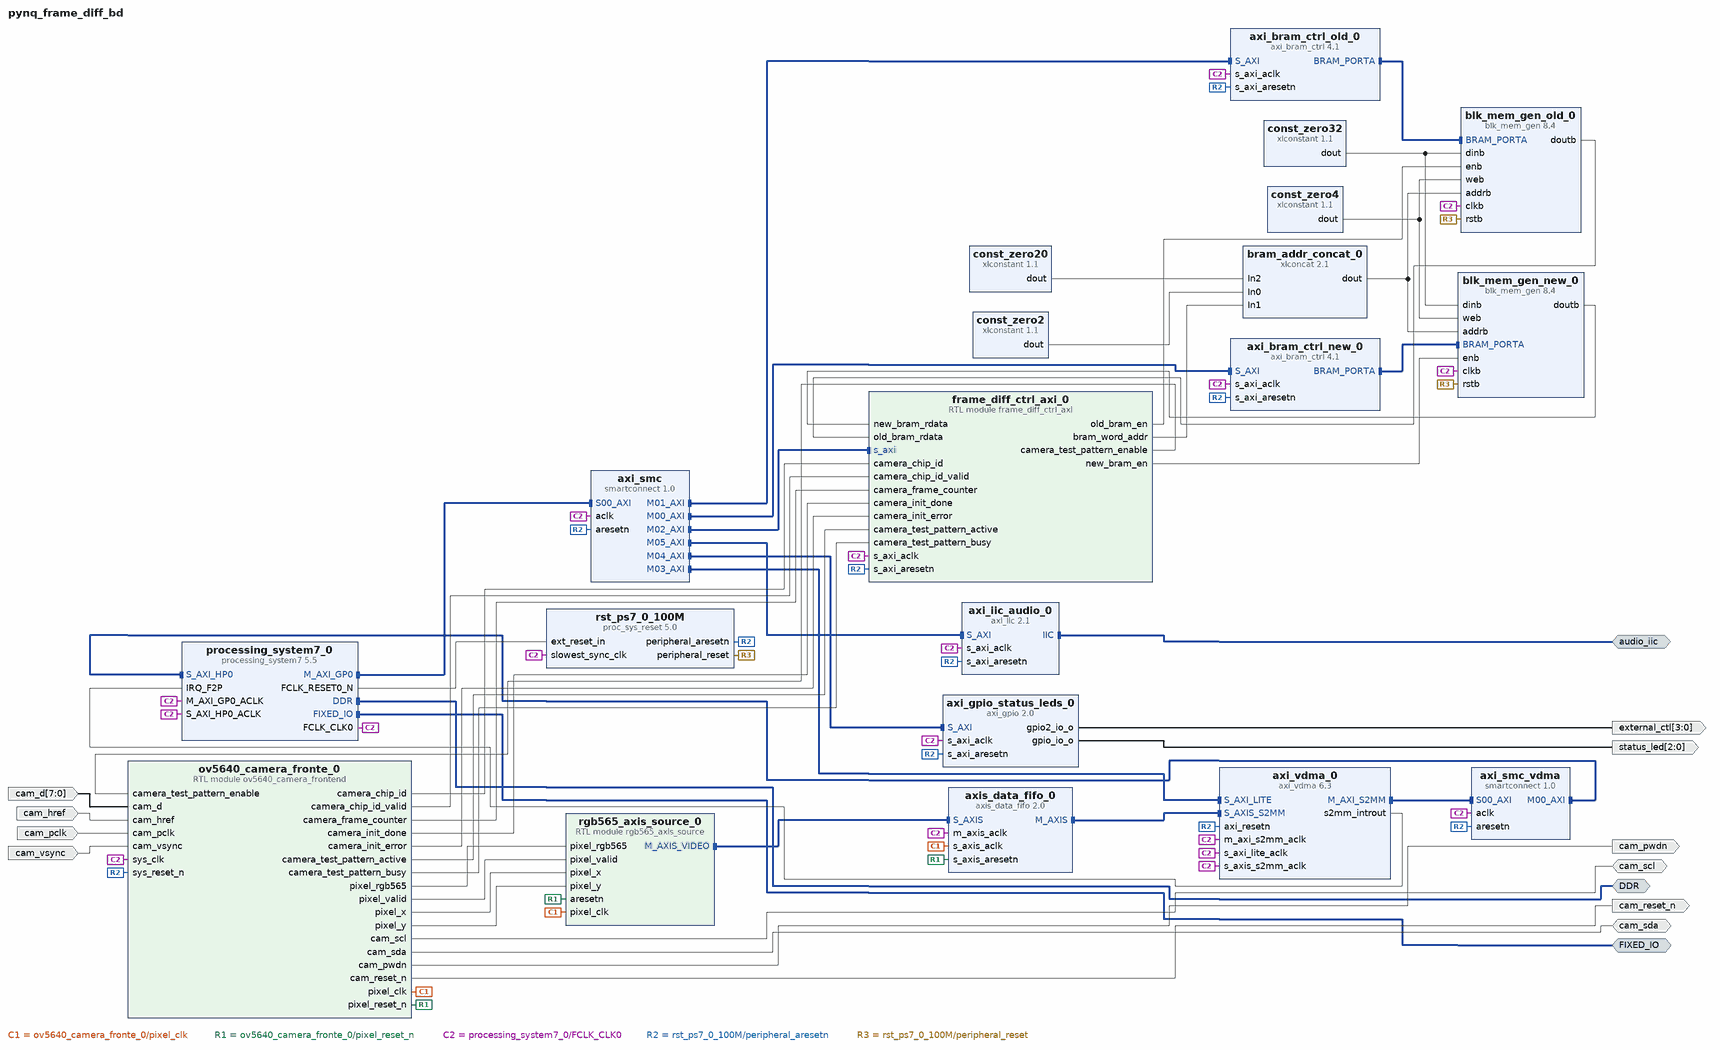
[diagram p0: block diagram of the top level]
# Vivado block design pynq_frame_diff_bd, xc7z020clg400-1, Vivado 2024.1
create_bd_design pynq_frame_diff_bd

create_bd_intf_port -mode Master -vlnv xilinx.com:interface:ddrx_rtl:1.0 DDR
create_bd_intf_port -mode Master -vlnv xilinx.com:display_processing_system7:fixedio_rtl:1.0 FIXED_IO
create_bd_intf_port -mode Master -vlnv xilinx.com:interface:iic_rtl:1.0 audio_iic
create_bd_port -dir I cam_pclk
create_bd_port -dir I -from 7 -to 0 cam_d
create_bd_port -dir I cam_vsync
create_bd_port -dir I cam_href
create_bd_port -dir IO cam_scl
create_bd_port -dir IO cam_sda
create_bd_port -dir O cam_reset_n
create_bd_port -dir O cam_pwdn
create_bd_port -dir O -from 2 -to 0 status_led
create_bd_port -dir O -from 3 -to 0 external_ctl

create_bd_cell -type ip -vlnv xilinx.com:ip:processing_system7:5.5 processing_system7_0
set_property -dict [list \
  CONFIG.PCW_APU_PERIPHERAL_FREQMHZ 650 \
  CONFIG.PCW_CRYSTAL_PERIPHERAL_FREQMHZ 50 \
  CONFIG.PCW_ENET0_ENET0_IO {MIO 16 .. 27} \
  CONFIG.PCW_ENET0_GRP_MDIO_ENABLE 1 \
  CONFIG.PCW_ENET0_GRP_MDIO_IO {MIO 52 .. 53} \
  CONFIG.PCW_ENET0_PERIPHERAL_ENABLE 1 \
  CONFIG.PCW_ENET0_RESET_ENABLE 1 \
  CONFIG.PCW_ENET0_RESET_IO {MIO 9} \
  CONFIG.PCW_ENET_RESET_ENABLE 1 \
  CONFIG.PCW_ENET_RESET_SELECT {Share reset pin} \
  CONFIG.PCW_FPGA0_PERIPHERAL_FREQMHZ 100 \
  CONFIG.PCW_FPGA1_PERIPHERAL_FREQMHZ 50 \
  CONFIG.PCW_GPIO_MIO_GPIO_ENABLE 1 \
  CONFIG.PCW_GPIO_MIO_GPIO_IO MIO \
  CONFIG.PCW_I2C_RESET_ENABLE 1 \
  CONFIG.PCW_IRQ_F2P_INTR 1 \
  CONFIG.PCW_M_AXI_GP0_FREQMHZ 10 \
  CONFIG.PCW_PERIPHERAL_BOARD_PRESET part0 \
  CONFIG.PCW_PRESET_BANK1_VOLTAGE {LVCMOS 1.8V} \
  CONFIG.PCW_QSPI_GRP_FBCLK_ENABLE 1 \
  CONFIG.PCW_QSPI_GRP_FBCLK_IO {MIO 8} \
  CONFIG.PCW_QSPI_GRP_SINGLE_SS_ENABLE 1 \
  CONFIG.PCW_QSPI_GRP_SINGLE_SS_IO {MIO 1 .. 6} \
  CONFIG.PCW_QSPI_PERIPHERAL_ENABLE 1 \
  CONFIG.PCW_QSPI_QSPI_IO {MIO 1 .. 6} \
  CONFIG.PCW_SD0_GRP_CD_ENABLE 1 \
  CONFIG.PCW_SD0_GRP_CD_IO {MIO 47} \
  CONFIG.PCW_SD0_GRP_WP_ENABLE 0 \
  CONFIG.PCW_SD0_PERIPHERAL_ENABLE 1 \
  CONFIG.PCW_SD0_SD0_IO {MIO 40 .. 45} \
  CONFIG.PCW_SDIO_PERIPHERAL_FREQMHZ 50 \
  CONFIG.PCW_SINGLE_QSPI_DATA_MODE x4 \
  CONFIG.PCW_S_AXI_HP0_FREQMHZ 10 \
  CONFIG.PCW_UART0_PERIPHERAL_ENABLE 1 \
  CONFIG.PCW_UART0_UART0_IO {MIO 14 .. 15} \
  CONFIG.PCW_UART1_PERIPHERAL_ENABLE 0 \
  CONFIG.PCW_UART_PERIPHERAL_FREQMHZ 100 \
  CONFIG.PCW_UIPARAM_DDR_BUS_WIDTH {16 Bit} \
  CONFIG.PCW_UIPARAM_DDR_FREQ_MHZ 525 \
  CONFIG.PCW_UIPARAM_DDR_PARTNO {MT41J256M16 RE-125} \
  CONFIG.PCW_USB0_PERIPHERAL_ENABLE 1 \
  CONFIG.PCW_USB0_RESET_ENABLE 1 \
  CONFIG.PCW_USB0_RESET_IO {MIO 46} \
  CONFIG.PCW_USB0_USB0_IO {MIO 28 .. 39} \
  CONFIG.PCW_USB_RESET_ENABLE 1 \
  CONFIG.PCW_USB_RESET_SELECT {Share reset pin} \
  CONFIG.PCW_USE_FABRIC_INTERRUPT 1 \
  CONFIG.PCW_USE_S_AXI_HP0 1 \
] [get_bd_cells processing_system7_0]
# 495 more settings of processing_system7_0 are not shown: defaults, MIO pin electricals, DDR timing, and values the tool derives
create_bd_cell -type ip -vlnv xilinx.com:ip:axi_bram_ctrl:4.1 axi_bram_ctrl_old_0
set_property -dict {CONFIG.SINGLE_PORT_BRAM 1} [get_bd_cells axi_bram_ctrl_old_0]
create_bd_cell -type ip -vlnv xilinx.com:ip:axi_bram_ctrl:4.1 axi_bram_ctrl_new_0
set_property -dict {CONFIG.SINGLE_PORT_BRAM 1} [get_bd_cells axi_bram_ctrl_new_0]
create_bd_cell -type ip -vlnv xilinx.com:ip:blk_mem_gen:8.4 blk_mem_gen_old_0
set_property -dict [list \
  CONFIG.Assume_Synchronous_Clk true \
  CONFIG.EN_SAFETY_CKT false \
  CONFIG.Memory_Type True_Dual_Port_RAM \
] [get_bd_cells blk_mem_gen_old_0]
create_bd_cell -type ip -vlnv xilinx.com:ip:blk_mem_gen:8.4 blk_mem_gen_new_0
set_property -dict [list \
  CONFIG.Assume_Synchronous_Clk true \
  CONFIG.EN_SAFETY_CKT false \
  CONFIG.Memory_Type True_Dual_Port_RAM \
] [get_bd_cells blk_mem_gen_new_0]
create_bd_cell -type ip -vlnv xilinx.com:ip:smartconnect:1.0 axi_smc
set_property -dict {CONFIG.NUM_MI 6 CONFIG.NUM_SI 1} [get_bd_cells axi_smc]
create_bd_cell -type ip -vlnv xilinx.com:ip:proc_sys_reset:5.0 rst_ps7_0_100M
create_bd_cell -type ip -vlnv xilinx.com:ip:xlconstant:1.1 const_zero32
set_property -dict {CONFIG.CONST_VAL 0 CONFIG.CONST_WIDTH 32} [get_bd_cells const_zero32]
create_bd_cell -type ip -vlnv xilinx.com:ip:xlconstant:1.1 const_zero4
set_property -dict {CONFIG.CONST_VAL 0 CONFIG.CONST_WIDTH 4} [get_bd_cells const_zero4]
create_bd_cell -type ip -vlnv xilinx.com:ip:xlconcat:2.1 bram_addr_concat_0
set_property -dict [list \
  CONFIG.IN0_WIDTH 2 \
  CONFIG.IN1_WIDTH 10 \
  CONFIG.IN2_WIDTH 20 \
  CONFIG.NUM_PORTS 3 \
] [get_bd_cells bram_addr_concat_0]
create_bd_cell -type ip -vlnv xilinx.com:ip:xlconstant:1.1 const_zero2
set_property -dict {CONFIG.CONST_VAL 0 CONFIG.CONST_WIDTH 2} [get_bd_cells const_zero2]
create_bd_cell -type ip -vlnv xilinx.com:ip:xlconstant:1.1 const_zero20
set_property -dict {CONFIG.CONST_VAL 0 CONFIG.CONST_WIDTH 20} [get_bd_cells const_zero20]
create_bd_cell -type module -reference rgb565_axis_source rgb565_axis_source_0
create_bd_cell -type ip -vlnv xilinx.com:ip:axis_data_fifo:2.0 axis_data_fifo_0
set_property -dict [list \
  CONFIG.FIFO_DEPTH 1024 \
  CONFIG.HAS_TKEEP 1 \
  CONFIG.HAS_TLAST 1 \
  CONFIG.IS_ACLK_ASYNC 1 \
  CONFIG.TDATA_NUM_BYTES 2 \
  CONFIG.TUSER_WIDTH 1 \
] [get_bd_cells axis_data_fifo_0]
create_bd_cell -type ip -vlnv xilinx.com:ip:axi_vdma:6.3 axi_vdma_0
set_property -dict [list \
  CONFIG.c_include_mm2s 0 \
  CONFIG.c_m_axi_s2mm_data_width 64 \
  CONFIG.c_num_fstores 2 \
  CONFIG.c_s2mm_genlock_mode 0 \
  CONFIG.c_s2mm_max_burst_length 16 \
] [get_bd_cells axi_vdma_0]
create_bd_cell -type ip -vlnv xilinx.com:ip:smartconnect:1.0 axi_smc_vdma
set_property -dict {CONFIG.NUM_MI 1 CONFIG.NUM_SI 1} [get_bd_cells axi_smc_vdma]
create_bd_cell -type module -reference ov5640_camera_frontend ov5640_camera_fronte_0
create_bd_cell -type module -reference frame_diff_ctrl_axi frame_diff_ctrl_axi_0
create_bd_cell -type ip -vlnv xilinx.com:ip:axi_gpio:2.0 axi_gpio_status_leds_0
set_property -dict [list \
  CONFIG.C_ALL_OUTPUTS 1 \
  CONFIG.C_ALL_OUTPUTS_2 1 \
  CONFIG.C_DOUT_DEFAULT 0x00000000 \
  CONFIG.C_DOUT_DEFAULT_2 0x00000000 \
  CONFIG.C_GPIO2_WIDTH 4 \
  CONFIG.C_GPIO_WIDTH 3 \
  CONFIG.C_INTERRUPT_PRESENT 0 \
  CONFIG.C_IS_DUAL 1 \
] [get_bd_cells axi_gpio_status_leds_0]
create_bd_cell -type ip -vlnv xilinx.com:ip:axi_iic:2.1 axi_iic_audio_0

# ---- connections ----

connect_bd_intf_net -intf_net audio_iic_net [get_bd_intf_pins axi_iic_audio_0/IIC] [get_bd_intf_ports audio_iic]
connect_bd_intf_net [get_bd_intf_pins axi_bram_ctrl_new_0/BRAM_PORTA] [get_bd_intf_pins blk_mem_gen_new_0/BRAM_PORTA]
connect_bd_intf_net [get_bd_intf_pins axi_bram_ctrl_old_0/BRAM_PORTA] [get_bd_intf_pins blk_mem_gen_old_0/BRAM_PORTA]
connect_bd_intf_net [get_bd_intf_pins axi_smc/M00_AXI] [get_bd_intf_pins axi_bram_ctrl_new_0/S_AXI]
connect_bd_intf_net [get_bd_intf_pins axi_smc/M01_AXI] [get_bd_intf_pins axi_bram_ctrl_old_0/S_AXI]
connect_bd_intf_net [get_bd_intf_pins axi_smc/M02_AXI] [get_bd_intf_pins frame_diff_ctrl_axi_0/s_axi]
connect_bd_intf_net [get_bd_intf_pins axi_smc/M03_AXI] [get_bd_intf_pins axi_vdma_0/S_AXI_LITE]
connect_bd_intf_net [get_bd_intf_pins axi_smc/M04_AXI] [get_bd_intf_pins axi_gpio_status_leds_0/S_AXI]
connect_bd_intf_net [get_bd_intf_pins axi_smc/M05_AXI] [get_bd_intf_pins axi_iic_audio_0/S_AXI]
connect_bd_intf_net [get_bd_intf_pins axi_smc_vdma/M00_AXI] [get_bd_intf_pins processing_system7_0/S_AXI_HP0]
connect_bd_intf_net [get_bd_intf_pins axi_vdma_0/M_AXI_S2MM] [get_bd_intf_pins axi_smc_vdma/S00_AXI]
connect_bd_intf_net [get_bd_intf_pins axis_data_fifo_0/M_AXIS] [get_bd_intf_pins axi_vdma_0/S_AXIS_S2MM]
connect_bd_intf_net [get_bd_intf_ports DDR] [get_bd_intf_pins processing_system7_0/DDR]
connect_bd_intf_net [get_bd_intf_ports FIXED_IO] [get_bd_intf_pins processing_system7_0/FIXED_IO]
connect_bd_intf_net [get_bd_intf_pins processing_system7_0/M_AXI_GP0] [get_bd_intf_pins axi_smc/S00_AXI]
connect_bd_intf_net [get_bd_intf_pins rgb565_axis_source_0/M_AXIS_VIDEO] [get_bd_intf_pins axis_data_fifo_0/S_AXIS]
connect_bd_net [get_bd_ports cam_scl] [get_bd_pins ov5640_camera_fronte_0/cam_scl]
connect_bd_net [get_bd_ports cam_sda] [get_bd_pins ov5640_camera_fronte_0/cam_sda]
connect_bd_net [get_bd_pins axi_gpio_status_leds_0/gpio_io_o] [get_bd_ports status_led]
connect_bd_net [get_bd_pins axi_vdma_0/s2mm_introut] [get_bd_pins processing_system7_0/IRQ_F2P]
connect_bd_net [get_bd_pins blk_mem_gen_new_0/doutb] [get_bd_pins frame_diff_ctrl_axi_0/new_bram_rdata]
connect_bd_net [get_bd_pins blk_mem_gen_old_0/doutb] [get_bd_pins frame_diff_ctrl_axi_0/old_bram_rdata]
connect_bd_net [get_bd_pins bram_addr_concat_0/dout] [get_bd_pins blk_mem_gen_old_0/addrb] [get_bd_pins blk_mem_gen_new_0/addrb]
connect_bd_net -net cam_d_0_1 [get_bd_ports cam_d] [get_bd_pins ov5640_camera_fronte_0/cam_d]
connect_bd_net -net cam_href_0_1 [get_bd_ports cam_href] [get_bd_pins ov5640_camera_fronte_0/cam_href]
connect_bd_net -net cam_pclk_0_1 [get_bd_ports cam_pclk] [get_bd_pins ov5640_camera_fronte_0/cam_pclk]
connect_bd_net -net cam_vsync_0_1 [get_bd_ports cam_vsync] [get_bd_pins ov5640_camera_fronte_0/cam_vsync]
connect_bd_net [get_bd_pins const_zero20/dout] [get_bd_pins bram_addr_concat_0/In2]
connect_bd_net [get_bd_pins const_zero2/dout] [get_bd_pins bram_addr_concat_0/In0]
connect_bd_net [get_bd_pins const_zero32/dout] [get_bd_pins blk_mem_gen_old_0/dinb] [get_bd_pins blk_mem_gen_new_0/dinb]
connect_bd_net [get_bd_pins const_zero4/dout] [get_bd_pins blk_mem_gen_old_0/web] [get_bd_pins blk_mem_gen_new_0/web]
connect_bd_net -net external_ctl_net [get_bd_pins axi_gpio_status_leds_0/gpio2_io_o] [get_bd_ports external_ctl]
connect_bd_net [get_bd_pins frame_diff_ctrl_axi_0/bram_word_addr] [get_bd_pins bram_addr_concat_0/In1]
connect_bd_net [get_bd_pins frame_diff_ctrl_axi_0/camera_test_pattern_enable] [get_bd_pins ov5640_camera_fronte_0/camera_test_pattern_enable]
connect_bd_net [get_bd_pins frame_diff_ctrl_axi_0/new_bram_en] [get_bd_pins blk_mem_gen_new_0/enb]
connect_bd_net [get_bd_pins frame_diff_ctrl_axi_0/old_bram_en] [get_bd_pins blk_mem_gen_old_0/enb]
connect_bd_net [get_bd_pins ov5640_camera_fronte_0/cam_pwdn] [get_bd_ports cam_pwdn]
connect_bd_net [get_bd_pins ov5640_camera_fronte_0/cam_reset_n] [get_bd_ports cam_reset_n]
connect_bd_net [get_bd_pins ov5640_camera_fronte_0/camera_chip_id] [get_bd_pins frame_diff_ctrl_axi_0/camera_chip_id]
connect_bd_net [get_bd_pins ov5640_camera_fronte_0/camera_chip_id_valid] [get_bd_pins frame_diff_ctrl_axi_0/camera_chip_id_valid]
connect_bd_net [get_bd_pins ov5640_camera_fronte_0/camera_frame_counter] [get_bd_pins frame_diff_ctrl_axi_0/camera_frame_counter]
connect_bd_net [get_bd_pins ov5640_camera_fronte_0/camera_init_done] [get_bd_pins frame_diff_ctrl_axi_0/camera_init_done]
connect_bd_net [get_bd_pins ov5640_camera_fronte_0/camera_init_error] [get_bd_pins frame_diff_ctrl_axi_0/camera_init_error]
connect_bd_net [get_bd_pins ov5640_camera_fronte_0/camera_test_pattern_active] [get_bd_pins frame_diff_ctrl_axi_0/camera_test_pattern_active]
connect_bd_net [get_bd_pins ov5640_camera_fronte_0/camera_test_pattern_busy] [get_bd_pins frame_diff_ctrl_axi_0/camera_test_pattern_busy]
connect_bd_net [get_bd_pins ov5640_camera_fronte_0/pixel_clk] [get_bd_pins rgb565_axis_source_0/pixel_clk] [get_bd_pins axis_data_fifo_0/s_axis_aclk]
connect_bd_net [get_bd_pins ov5640_camera_fronte_0/pixel_reset_n] \
  [get_bd_pins rgb565_axis_source_0/aresetn] [get_bd_pins axis_data_fifo_0/s_axis_aresetn]
connect_bd_net [get_bd_pins ov5640_camera_fronte_0/pixel_rgb565] [get_bd_pins rgb565_axis_source_0/pixel_rgb565]
connect_bd_net [get_bd_pins ov5640_camera_fronte_0/pixel_valid] [get_bd_pins rgb565_axis_source_0/pixel_valid]
connect_bd_net [get_bd_pins ov5640_camera_fronte_0/pixel_x] [get_bd_pins rgb565_axis_source_0/pixel_x]
connect_bd_net [get_bd_pins ov5640_camera_fronte_0/pixel_y] [get_bd_pins rgb565_axis_source_0/pixel_y]
connect_bd_net [get_bd_pins processing_system7_0/FCLK_CLK0] \
  [get_bd_pins processing_system7_0/M_AXI_GP0_ACLK] [get_bd_pins axi_smc/aclk] [get_bd_pins axi_bram_ctrl_new_0/s_axi_aclk] \
  [get_bd_pins rst_ps7_0_100M/slowest_sync_clk] [get_bd_pins axi_bram_ctrl_old_0/s_axi_aclk] \
  [get_bd_pins blk_mem_gen_old_0/clkb] [get_bd_pins blk_mem_gen_new_0/clkb] [get_bd_pins axis_data_fifo_0/m_axis_aclk] \
  [get_bd_pins axi_vdma_0/s_axi_lite_aclk] [get_bd_pins axi_vdma_0/m_axi_s2mm_aclk] [get_bd_pins axi_vdma_0/s_axis_s2mm_aclk] \
  [get_bd_pins processing_system7_0/S_AXI_HP0_ACLK] [get_bd_pins axi_smc_vdma/aclk] \
  [get_bd_pins axi_gpio_status_leds_0/s_axi_aclk] [get_bd_pins frame_diff_ctrl_axi_0/s_axi_aclk] \
  [get_bd_pins ov5640_camera_fronte_0/sys_clk] [get_bd_pins axi_iic_audio_0/s_axi_aclk]
connect_bd_net [get_bd_pins processing_system7_0/FCLK_RESET0_N] [get_bd_pins rst_ps7_0_100M/ext_reset_in]
connect_bd_net [get_bd_pins rst_ps7_0_100M/peripheral_aresetn] \
  [get_bd_pins axi_bram_ctrl_new_0/s_axi_aresetn] [get_bd_pins axi_smc/aresetn] \
  [get_bd_pins axi_bram_ctrl_old_0/s_axi_aresetn] [get_bd_pins axi_vdma_0/axi_resetn] [get_bd_pins axi_smc_vdma/aresetn] \
  [get_bd_pins axi_gpio_status_leds_0/s_axi_aresetn] [get_bd_pins frame_diff_ctrl_axi_0/s_axi_aresetn] \
  [get_bd_pins ov5640_camera_fronte_0/sys_reset_n] [get_bd_pins axi_iic_audio_0/s_axi_aresetn]
connect_bd_net [get_bd_pins rst_ps7_0_100M/peripheral_reset] [get_bd_pins blk_mem_gen_old_0/rstb] [get_bd_pins blk_mem_gen_new_0/rstb]
set_property HDL_ATTRIBUTE.BMM_INFO_PROCESSOR {arm > pynq_frame_diff_bd axi_bram_ctrl_new_0 pynq_frame_diff_bd axi_bram_ctrl_old_0} [get_bd_cells processing_system7_0]
set_property HDL_ATTRIBUTE.KEEP_HIERARCHY yes [get_bd_cells processing_system7_0]
set_property HDL_ATTRIBUTE.BMM_INFO_ADDRESS_SPACE {byte  0x42000000 32 > pynq_frame_diff_bd blk_mem_gen_old_0} [get_bd_cells axi_bram_ctrl_old_0]
set_property HDL_ATTRIBUTE.KEEP_HIERARCHY yes [get_bd_cells axi_bram_ctrl_old_0]
set_property HDL_ATTRIBUTE.BMM_INFO_ADDRESS_SPACE {byte  0x40000000 32 > pynq_frame_diff_bd blk_mem_gen_new_0} [get_bd_cells axi_bram_ctrl_new_0]
set_property HDL_ATTRIBUTE.KEEP_HIERARCHY yes [get_bd_cells axi_bram_ctrl_new_0]

# ---- address map ----
assign_bd_address -offset 0x00000000 -range 512M -target_address_space [get_bd_addr_spaces axi_vdma_0/Data_S2MM] [get_bd_addr_segs processing_system7_0/S_AXI_HP0/HP0_DDR_LOWOCM]
assign_bd_address -offset 0x40000000 -range 4K -target_address_space [get_bd_addr_spaces processing_system7_0/Data] [get_bd_addr_segs axi_bram_ctrl_new_0/S_AXI/Mem0]
assign_bd_address -offset 0x40002000 -range 4K -target_address_space [get_bd_addr_spaces processing_system7_0/Data] [get_bd_addr_segs frame_diff_ctrl_axi_0/s_axi/reg0]
assign_bd_address -offset 0x41200000 -range 4K -target_address_space [get_bd_addr_spaces processing_system7_0/Data] [get_bd_addr_segs axi_gpio_status_leds_0/S_AXI/Reg]
assign_bd_address -offset 0x41600000 -range 64K -target_address_space [get_bd_addr_spaces processing_system7_0/Data] [get_bd_addr_segs axi_iic_audio_0/S_AXI/Reg]
assign_bd_address -offset 0x42000000 -range 4K -target_address_space [get_bd_addr_spaces processing_system7_0/Data] [get_bd_addr_segs axi_bram_ctrl_old_0/S_AXI/Mem0]
assign_bd_address -offset 0x43000000 -range 64K -target_address_space [get_bd_addr_spaces processing_system7_0/Data] [get_bd_addr_segs axi_vdma_0/S_AXI_LITE/Reg]

validate_bd_design
save_bd_design
